# Altium schematic sheet ADC_low_pass_filter.SchDoc
size A4; SheetNumber: 4; SheetTotal: 13
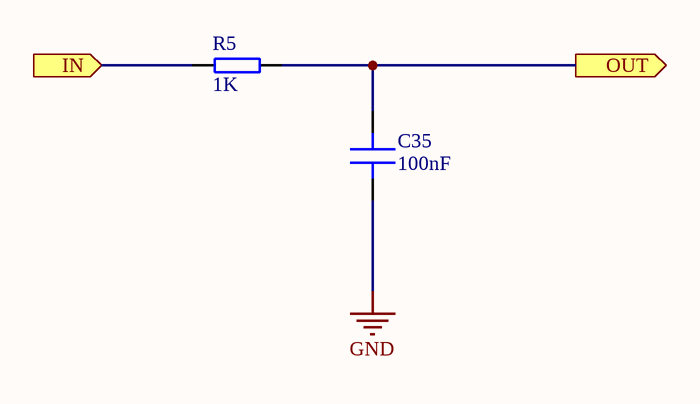
[diagram p0: ADC_low_pass_filter.SchDoc]

## Parts
C35  100nF  [C 0402]
R5  1K  [R 0402]

## Ports
IN (in), OUT (out)

## Nets
GND: C35.2
IN: R5.1 ; port IN
OUT: C35.1 R5.2 ; port OUT

## Library data of the parts
C35 = Capacitor: MLCC Capacitor
R5 = Resistor: General pourpouse resistor